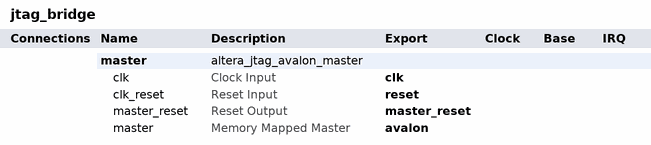
[diagram p0: system contents]
# Platform Designer (Qsys) system jtag_bridge, MAX 10 10M50DAF484C7G
# Parameters at their usual value, and those the tool derives, are not listed.
package require -exact qsys 23.1
create_system jtag_bridge
set_project_property DEVICE_FAMILY {MAX 10}
set_project_property DEVICE 10M50DAF484C7G

add_instance master altera_jtag_avalon_master 23.1

# exported interfaces
add_interface avalon avalon master
set_interface_property avalon EXPORT_OF master.master
add_interface clk clock sink
set_interface_property clk EXPORT_OF master.clk
add_interface master_reset reset source
set_interface_property master_reset EXPORT_OF master.master_reset
add_interface reset reset sink
set_interface_property reset EXPORT_OF master.clk_reset

set_interconnect_requirement {$system} qsys_mm.clockCrossingAdapter HANDSHAKE
set_interconnect_requirement {$system} qsys_mm.enableEccProtection FALSE
set_interconnect_requirement {$system} qsys_mm.insertDefaultSlave FALSE
set_interconnect_requirement {$system} qsys_mm.maxAdditionalLatency 1

save_system jtag_bridge.qsys
